# Altium schematic sheet Display-Sheet.SchDoc
size A4; SheetNumber: 5; SheetTotal: 5
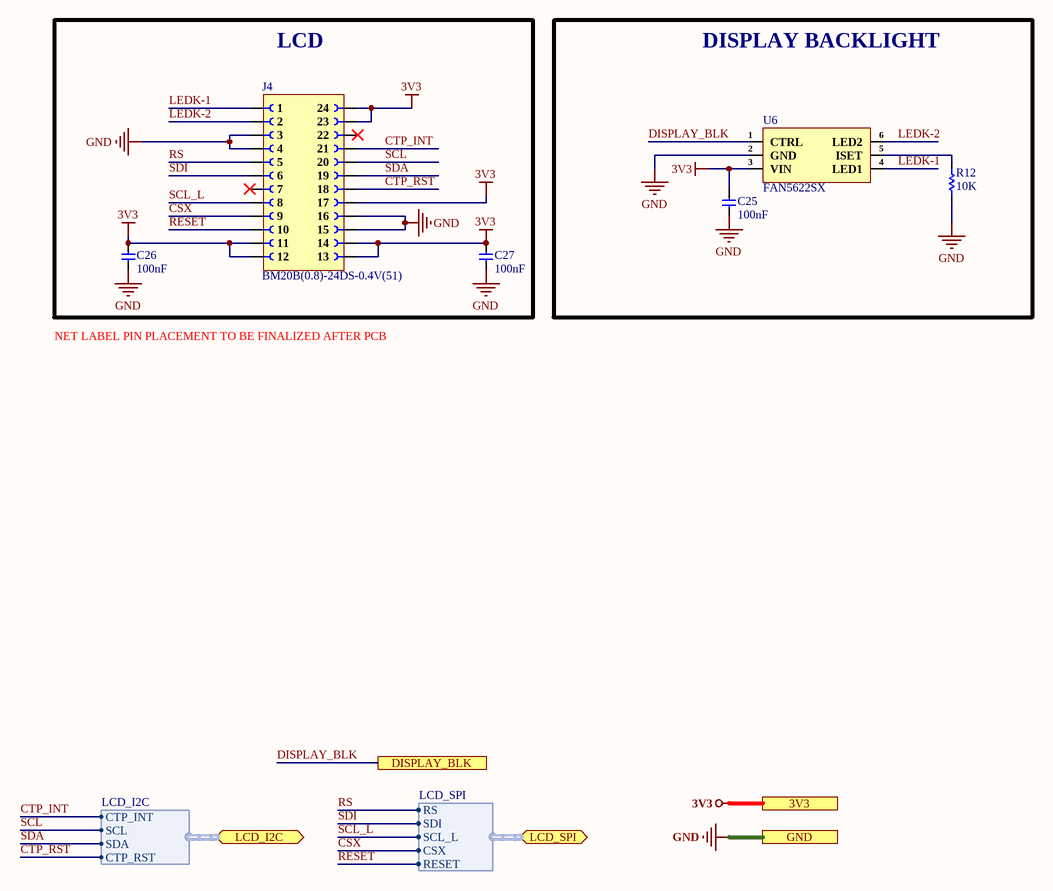
[diagram p0: Display-Sheet.SchDoc]

## Parts
C25  100nF  [CAP-0201]
C26  100nF  [CAP-0201]
C27  100nF  [CAP-0201]
J4  BM20B(0.8)-24DS-0.4V(51)  [BM20B(0.8)-24DS-0.4V(51)]
R12  10K  [Res-0201]
U6  FAN5622SX  [SuperSOT-6]

## Blocks framed on the sheet
LCD: C26 C27 J4
DISPLAY BACKLIGHT: C25 R12 U6

## Ports
3V3 (see Top-Sheet[3B], Controller-Sheet[3D], Power-Sheet[2D], Sensor-Sheet[3C]), DISPLAY_BLK (see Top-Sheet[3B], Controller-Sheet[3D]), GND (see Top-Sheet[3B], Controller-Sheet[3D], Power-Sheet[2D], Sensor-Sheet[3C]), LCD_I2C (bidir, harness LCD_I2C, see Top-Sheet[3B], Controller-Sheet[1D]), LCD_SPI (bidir, harness LCD_SPI, see Top-Sheet[3B], Controller-Sheet[2D])

## Harnesses
LCD_SPI: RS, SDI, SCL_L, CSX, RESET
LCD_I2C: CTP_INT, SCL, SDA, CTP_RST

## Nets
3V3: C25.2 C26.2 C27.2 J4.11 J4.12 J4.13 J4.14 J4.17 J4.23 J4.24 U6.3(VIN) ; port 3V3
GND: C25.1 C26.1 C27.1 J4.3 J4.4 J4.15 J4.16 R12.1 U6.2(GND) ; port GND
CSX: J4.9 ; port LCD_SPI.CSX
CTP_INT: J4.21 ; port LCD_I2C.CTP_INT
CTP_RST: J4.18 ; port LCD_I2C.CTP_RST
DISPLAY_BLK: U6.1(CTRL) ; port DISPLAY_BLK
LEDK-1: J4.1 U6.4(LED1)
LEDK-2: J4.2 U6.6(LED2)
RESET: J4.10 ; port LCD_SPI.RESET
RS: J4.5 ; port LCD_SPI.RS
SCL: J4.20 ; port LCD_I2C.SCL
SCL_L: J4.8 ; port LCD_SPI.SCL_L
SDA: J4.19 ; port LCD_I2C.SDA
SDI: J4.6 ; port LCD_SPI.SDI
NetR12_2: R12.2 U6.5(ISET)

Not connected (* = marked no-connect by the designer): J4 7* 22*

## Notes on the sheet
- NET LABEL PIN PLACEMENT TO BE FINALIZED AFTER PCB
- File:
- Title:
- Date:
- Page
- Num:
- Total:
- Drawn By: Huzaifa Ali

## Library data of the parts
C25-C27 = CC0201KRX5R6BB104: CAP CER 0.1UF 10V X5R 0201; Manufacturer: Yageo; Tolerance: 10%; Supplier 1: Mouser; Manufacturer Part Number: CC0201KRX5R6BB104; RoHS: Yes; Category: Ceramic Capacitors; Stock 1: 824403; Pricing 1: 1=0.10000, 10=0.02400, 50=0.02400, 100=0.01900, 1000=0.01100, 10000=0.00900 (USD); Mount: Surface Mount; Case/Package: 0201; Case Code (Imperial): 0201; Case Code (Metric): 0603; Weight: 6E-06oz; Min Operating Temperature: -55°C; Max Operating Temperature: 85°C; Capacitance: 100nF; Dielectric: X5R; Voltage Rating (DC): 10V; Packaging: Tape and Reel; Termination: SMD/SMT; Resistor Type: Ceramic; Voltage Rating: 10V; Series: CC; Construction: Flat; Length: 0.6mm; Width: 0.012inch; Height: 0.3mm; Thickness: 0.013inch; Depth: 0.3mm; Radiation Hardening: No; Lead Free: Lead Free; Halogen Free: Halogen Free; RoHS Compliant: Yes; ComponentLink1URL: https://datasheet.ciiva.com/11587/upy-gphc-x5r-4v-to-50v-12-11587190.pdf?src-supplier=Avnet; ComponentLink1Description: https://datasheet.ciiva.com/11587/upy-gphc-x5r-4v-to-50v-12-11587190.pdf?src-supplier=Avnet; Supplier Part Number 1: 603-CC201KRX5R6BB104; LCSC Part Number: C190183
J4 = BM20B(0.8)-24DS-0.4V(51): CONN RCPT 24POS SMD GOLD; Manufacturer: Hirose Electric Co Ltd; Item Type: Connectors (Board to Board); Manufacturer Part Number: BM20B(0.8)-24DS-0.4V(51); Package: Custom; LCSC Part Number: C424537; ComponentLink1Description: LCSC; Supplier: Digi-Key; Supplier Part Number: 26-BM20B(0.8)-24DS-0.4V(51)CT-ND; RoHS: Yes; Category: Connectors; Stock: 5402; Pricing: 1=1.32, 10=1.114, 25=1.068, 50=1.0454, 100=0.9999, 250=0.909, 500=0.8181, 1000=0.7272, 2500=0.65902 (USD); ComponentLink2URL: https://datasheet.ciiva.com/24244/en-bm20-20130409-270407-24244272.pdf?src-supplier=Mouser; ComponentLink2Description: https://datasheet.ciiva.com/24244/en-bm20-20130409-270407-24244272.pdf?src-supplier=Mouser
R12 = RC0201FR-0710KL: RES SMD 10K OHM 1% 1/20W 0201; Manufacturer: Yageo; Item Type: Resistor; Manufacturer Part Number: RC0201FR-0710KL; Package: 0201; ComponentLink7Description: LCSC; ComponentLink7URL: https://www.lcsc.com/product-detail/Chip-Resistor-Surface-Mount_YAGEO-RC0201FR-0710KL_C106225.html; LCSC Part Number: C106225
U6 = FAN5622SX: IC LED DRV LIN SGL WR 30MA 6SSOT; Manufacturer: ON Semiconductor / Fairchild; Max Supply Voltage: 5.5V; Min Supply Voltage: 2.7V; Number of Outputs: 2; Max Supply Current: 800uA; Power Dissipation: 132mW; Number of Segments: 6; Max Output Voltage: 5V; Supplier: Rs; Supplier Part Number: 7396049P; Manufacturer Part Number: FAN5622SX; RoHS: Yes; Category: LED Drivers; Stock: 2995; Pricing: 10=0.48, 100=0.288, 1000=0.218, 3000=0.212 (GBP); Mounting Technology: Surface Mount; Case/Package: SOT-23-6; Pins: 23; Weight: 0.03g; Min Operating Temperature: -40°C; Max Operating Temperature: 85°C; Packaging: Tape and Reel; Package Quantity: 1; Output Current: 30mA; Current Rating: 30mA; Min Input Voltage: 2.7V; Series: -; Radiation Hardening: No; Lead Free: Lead Free; RoHS Compliant: Yes; ComponentLink1URL: https://datasheet.ciiva.com/1946/fan5622-1946946.pdf?src-supplier=Digi-Key; ComponentLink1Description: https://datasheet.ciiva.com/1946/fan5622-1946946.pdf?src-supplier=Digi-Key; ComponentLink2URL: https://datasheet.ciiva.com/1946/fan5622-1946947.pdf?src-supplier=Digi-Key; ComponentLink2Description: https://datasheet.ciiva.com/1946/fan5622-1946947.pdf?src-supplier=Digi-Key; ComponentLink3URL: https://datasheet.ciiva.com/1946/fan5622-1946948.pdf?src-supplier=Digi-Key; ComponentLink3Description: https://datasheet.ciiva.com/1946/fan5622-1946948.pdf?src-supplier=Digi-Key; ComponentLink4URL: https://datasheet.ciiva.com/3164/fan5624-3164252.pdf?src-supplier=Avnet; ComponentLink4Description: https://datasheet.ciiva.com/3164/fan5624-3164252.pdf?src-supplier=Avnet; JLCPCB: C890820; Item Type: IC